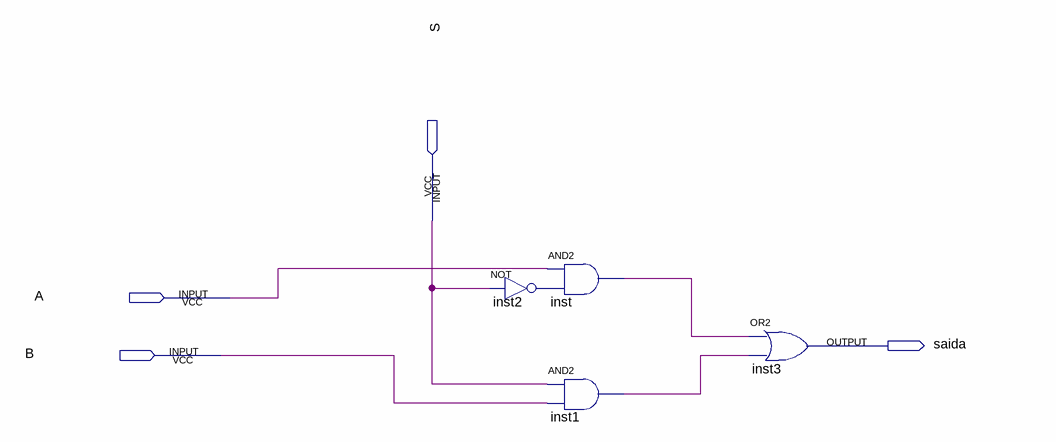
[diagram p0: schematic sheet]
// Quartus schematic mux.bdf as structural Verilog: 4 symbols, 4 pins
module mux (
  input  S,
  input  A,
  input  B,
  output saida
);

  wire inst1_out, inst2_out, inst_out;

  and inst (inst_out, A, inst2_out);
  not inst2 (inst2_out, S);
  and inst1 (inst1_out, S, B);
  or inst3 (saida, inst_out, inst1_out);
endmodule
